# Altium schematic sheet Zotino-connector.SchDoc
size A3
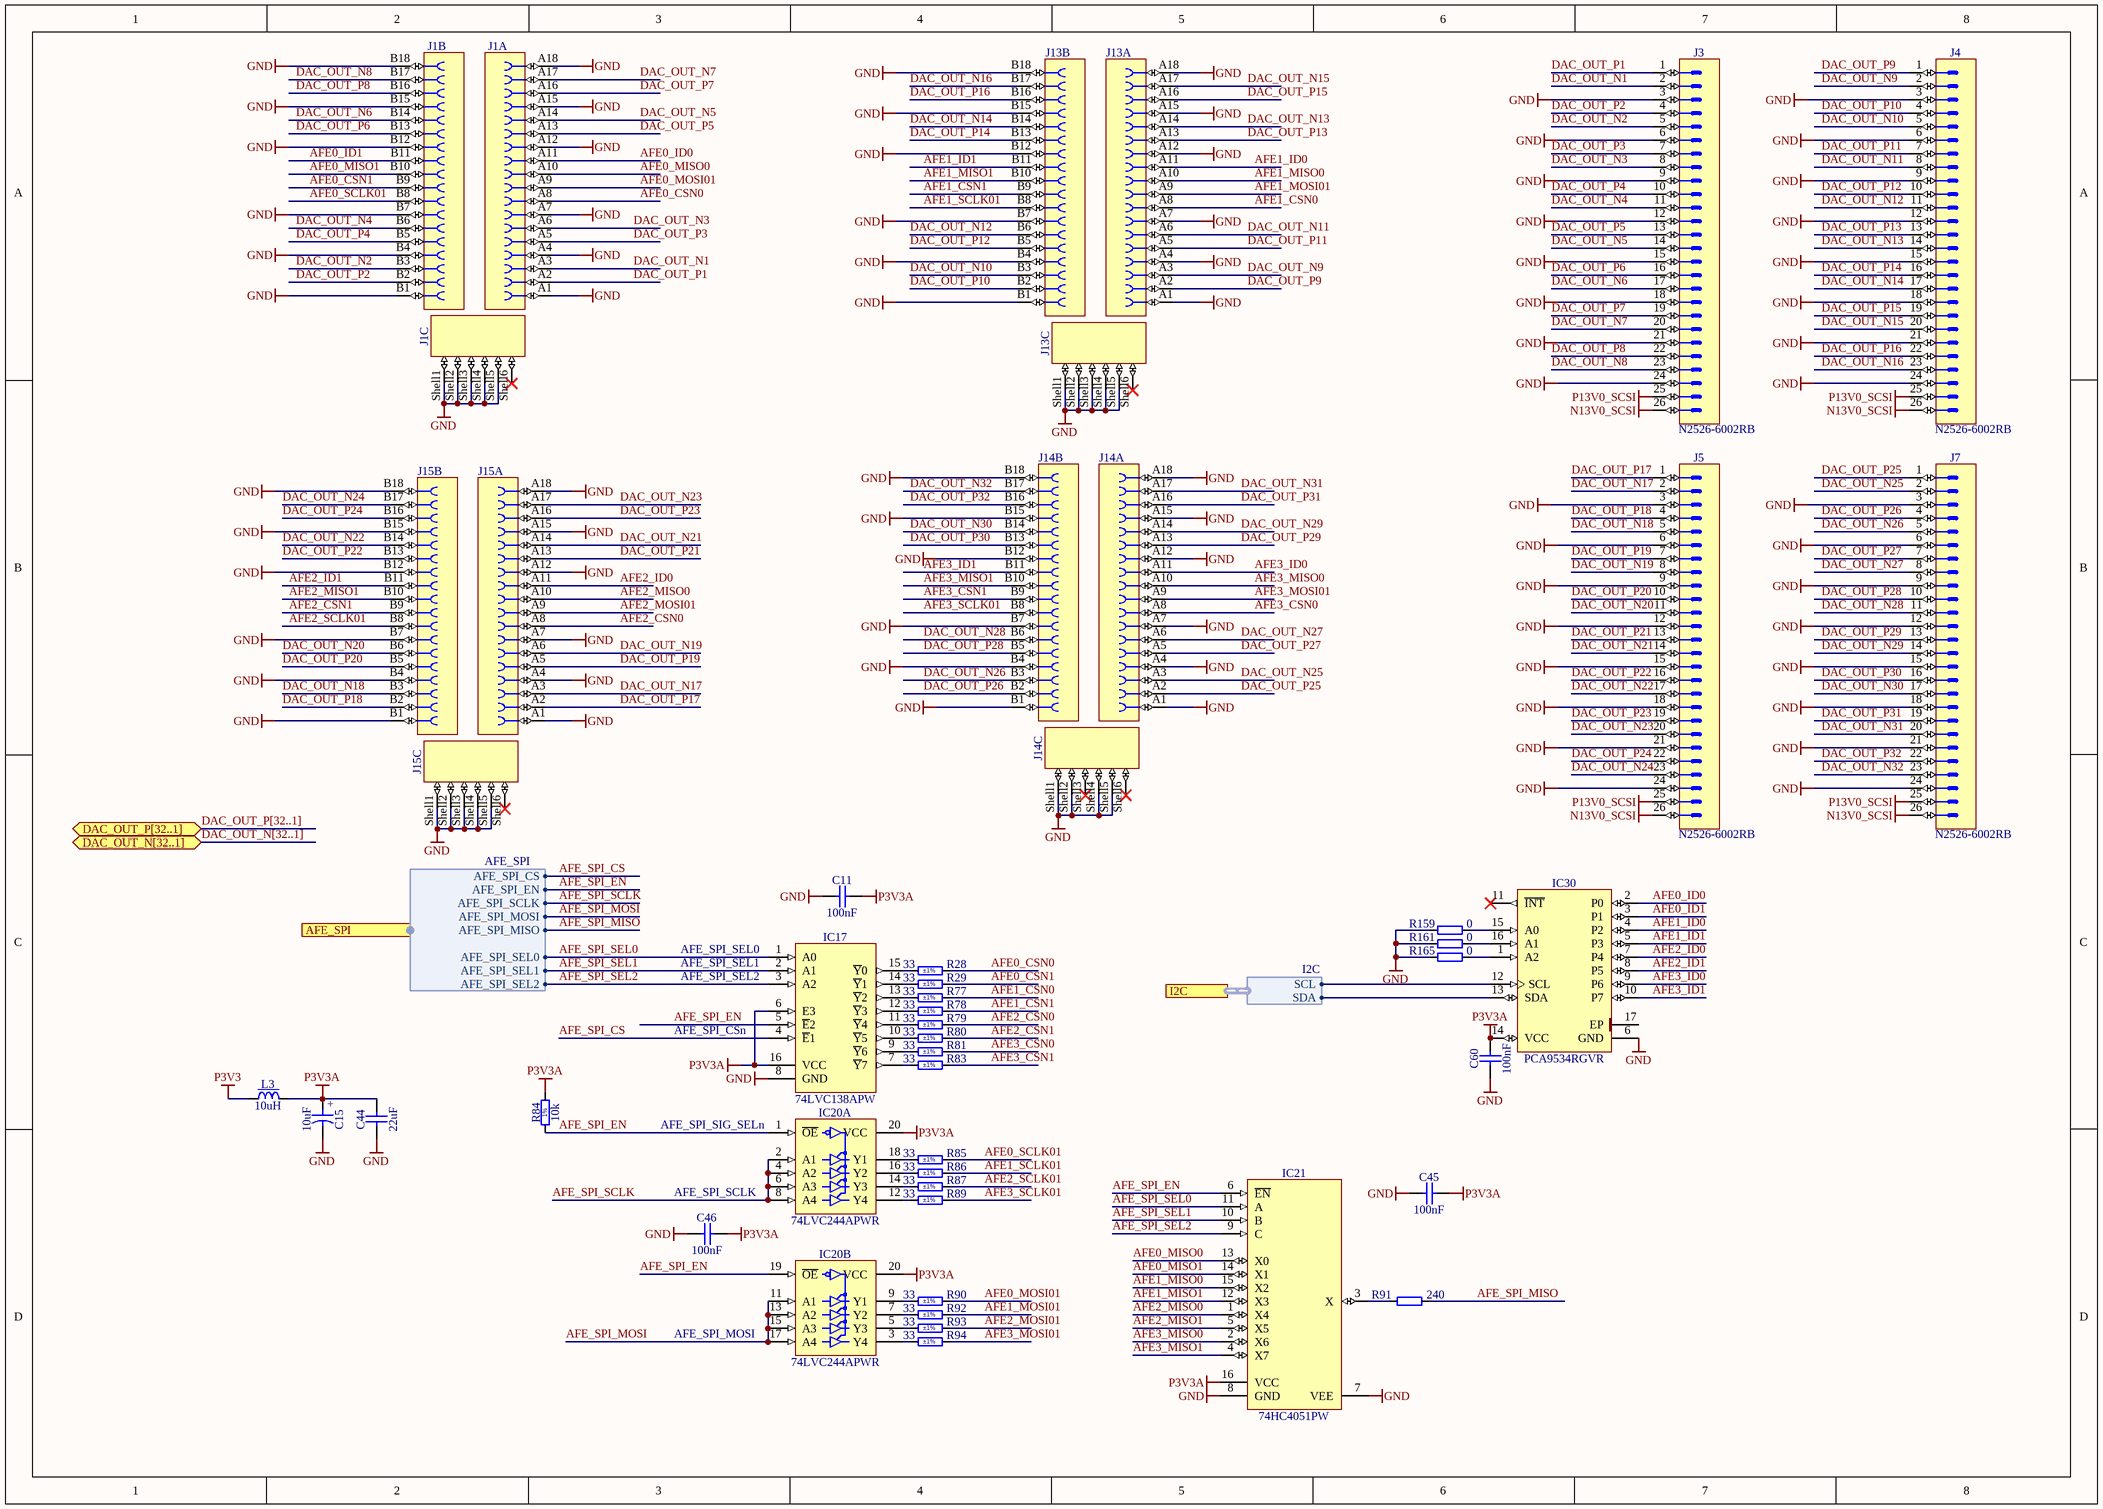
[diagram p0: Zotino-connector.SchDoc]

## Parts
C11  100nF  [CAPC1005X55N]
C15  10uF  [CAPMP3216X180N]
C44  22uF  [CAPC2012X135N]
C45  100nF  [CAPC1005X55N]
C46  100nF  [CAPC1005X55N]
C60  100nF  [CAPC1005X55N]
IC17  74LVC138APW  [SOP65P640X110-16N]
IC20  74LVC244APWR  [SOP65P640X110-20N]  (parts A,B of 2)
IC21  74HC4051PW  [SOP65P640X120-16N]
IC30  PCA9534RGVR  [QFN65P400X400X100-17N-S225]
J1  iPass™  [MOLEX_75783-0107]  (value not drawn)  (parts A,B,C of 3)
J3  Manufacturer Part Number: N2526-6002RB  [3M_N2526-6002RB]  (hidden comment: Header 26)
J4  Manufacturer Part Number: N2526-6002RB  [3M_N2526-6002RB]  (hidden comment: Header 26)
J5  Manufacturer Part Number: N2526-6002RB  [3M_N2526-6002RB]  (hidden comment: Header 26)
J7  Manufacturer Part Number: N2526-6002RB  [3M_N2526-6002RB]  (hidden comment: Header 26)
J13  iPass™  [MOLEX_75783-0107]  (value not drawn)  (parts A,B,C of 3)
J14  iPass™  [MOLEX_75783-0107]  (value not drawn)  (parts A,B,C of 3)
J15  iPass™  [MOLEX_75783-0107]  (value not drawn)  (parts A,B,C of 3)
L3  10uH  [IND_MURATA-PS_8400]
R28  33  Tolerance: ±1%  [RESC1005X40N]
R29  33  Tolerance: ±1%  [RESC1005X40N]
R77  33  Tolerance: ±1%  [RESC1005X40N]
R78  33  Tolerance: ±1%  [RESC1005X40N]
R79  33  Tolerance: ±1%  [RESC1005X40N]
R80  33  Tolerance: ±1%  [RESC1005X40N]
R81  33  Tolerance: ±1%  [RESC1005X40N]
R83  33  Tolerance: ±1%  [RESC1005X40N]
R84  10k  [RESC1005X40N]
R85  33  Tolerance: ±1%  [RESC1005X40N]
R86  33  Tolerance: ±1%  [RESC1005X40N]
R87  33  Tolerance: ±1%  [RESC1005X40N]
R89  33  Tolerance: ±1%  [RESC1005X40N]
R90  33  Tolerance: ±1%  [RESC1005X40N]
R91  240  [RESC1005X40N]
R92  33  Tolerance: ±1%  [RESC1005X40N]
R93  33  Tolerance: ±1%  [RESC1005X40N]
R94  33  Tolerance: ±1%  [RESC1005X40N]
R159  0  [RESC1005X40N]
R161  0  [RESC1005X40N]
R165  0  [RESC1005X40N]

## Ports
AFE_SPI (harness AFE_SPI), DAC_OUT_N[32..1] (bidir), DAC_OUT_P[32..1] (bidir), I2C (harness I2C)

## Harnesses
AFE_SPI: AFE_SPI_CS, AFE_SPI_EN, AFE_SPI_SCLK, AFE_SPI_MOSI, AFE_SPI_MISO, AFE_SPI_SEL0, AFE_SPI_SEL1, AFE_SPI_SEL2
I2C: SDA, SCL

## Nets
GND: C11.1 C15.2 C44.1 C45.1 C46.1 C60.1 IC17.8(GND) IC20.10(GND) IC21.7(VEE) IC21.8(GND) IC30.6(GND) J1.A1 J1.A4 J1.A7 J1.A12 J1.A15 J1.A18 J1.B1 J1.B4 J1.B7 J1.B12 J1.B15 J1.B18 J1.Shell1 J1.Shell2 J1.Shell3 J1.Shell4 J1.Shell5 J3.3 J3.6 J3.9 J3.12 J3.15 J3.18 J3.21 J3.24 J4.3 J4.6 J4.9 J4.12 J4.15 J4.18 J4.21 J4.24 J5.3 J5.6 J5.9 J5.12 J5.15 J5.18 J5.21 J5.24 J7.3 J7.6 J7.9 J7.12 J7.15 J7.18 J7.21 J7.24 J13.A1 J13.A4 J13.A7 J13.A12 J13.A15 J13.A18 J13.B1 J13.B4 J13.B7 J13.B12 J13.B15 J13.B18 J13.Shell1 J13.Shell2 J13.Shell3 J13.Shell4 J13.Shell5 J14.A1 J14.A4 J14.A7 J14.A12 J14.A15 J14.A18 J14.B1 J14.B4 J14.B7 J14.B12 J14.B15 J14.B18 J14.Shell1 J14.Shell2 J14.Shell4 J14.Shell5 J15.A1 J15.A4 J15.A7 J15.A12 J15.A15 J15.A18 J15.B1 J15.B4 J15.B7 J15.B12 J15.B15 J15.B18 J15.Shell1 J15.Shell2 J15.Shell3 J15.Shell4 J15.Shell5 R159.1 R161.1 R165.1
N13V0_SCSI: J3.26 J4.26 J5.26 J7.26
P3V3: L3.1
P3V3A: C11.2 C15.1 C44.2 C45.2 C46.2 C60.2 IC17.6(E3) IC17.16(VCC) IC20.20(VCC) IC21.16(VCC) IC30.14(VCC) L3.2 R84.2
P13V0_SCSI: J3.25 J4.25 J5.25 J7.25
AFE0_CSN0: J1.A8 R28.2
AFE0_CSN1: J1.B9 R29.2
AFE0_ID0: IC30.2(P0) J1.A11
AFE0_ID1: IC30.3(P1) J1.B11
AFE0_MISO0: IC21.13(X0) J1.A10
AFE0_MISO1: IC21.14(X1) J1.B10
AFE0_MOSI01: J1.A9 R90.2
AFE0_SCLK01: J1.B8 R85.2
AFE1_CSN0: J13.A8 R77.2
AFE1_CSN1: J13.B9 R78.2
AFE1_ID0: IC30.4(P2) J13.A11
AFE1_ID1: IC30.5(P3) J13.B11
AFE1_MISO0: IC21.15(X2) J13.A10
AFE1_MISO1: IC21.12(X3) J13.B10
AFE1_MOSI01: J13.A9 R92.2
AFE1_SCLK01: J13.B8 R86.2
AFE2_CSN0: J15.A8 R79.2
AFE2_CSN1: J15.B9 R80.2
AFE2_ID0: IC30.7(P4) J15.A11
AFE2_ID1: IC30.8(P5) J15.B11
AFE2_MISO0: IC21.1(X4) J15.A10
AFE2_MISO1: IC21.5(X5) J15.B10
AFE2_MOSI01: J15.A9 R93.2
AFE2_SCLK01: J15.B8 R87.2
AFE3_CSN0: J14.A8 R81.2
AFE3_CSN1: J14.B9 R83.2
AFE3_ID0: IC30.9(P6) J14.A11
AFE3_ID1: IC30.10(P7) J14.B11
AFE3_MISO0: IC21.2(X6) J14.A10
AFE3_MISO1: IC21.4(X7) J14.B10
AFE3_MOSI01: J14.A9 R94.2
AFE3_SCLK01: J14.B8 R89.2
AFE_SPI_CS: IC17.4(~{E}1) ; port AFE_SPI.AFE_SPI_CS
AFE_SPI_EN: IC17.5(~{E}2) IC20.1(~{OE}) IC20.19(~{OE}) IC21.6(~{EN}) R84.1 ; port AFE_SPI.AFE_SPI_EN
AFE_SPI_MISO: R91.2 ; port AFE_SPI.AFE_SPI_MISO
AFE_SPI_MOSI: IC20.11(A1) IC20.13(A2) IC20.15(A3) IC20.17(A4) ; port AFE_SPI.AFE_SPI_MOSI
AFE_SPI_SCLK: IC20.2(A1) IC20.4(A2) IC20.6(A3) IC20.8(A4) ; port AFE_SPI.AFE_SPI_SCLK
AFE_SPI_SEL0: IC17.1(A0) IC21.11(A) ; port AFE_SPI.AFE_SPI_SEL0
AFE_SPI_SEL1: IC17.2(A1) IC21.10(B) ; port AFE_SPI.AFE_SPI_SEL1
AFE_SPI_SEL2: IC17.3(A2) IC21.9(C) ; port AFE_SPI.AFE_SPI_SEL2
DAC_OUT_N1: J1.A3 J3.2
DAC_OUT_N2: J1.B3 J3.5
DAC_OUT_N3: J1.A6 J3.8
DAC_OUT_N4: J1.B6 J3.11
DAC_OUT_N5: J1.A14 J3.14
DAC_OUT_N6: J1.B14 J3.17
DAC_OUT_N7: J1.A17 J3.20
DAC_OUT_N8: J1.B17 J3.23
DAC_OUT_N9: J4.2 J13.A3
DAC_OUT_N10: J4.5 J13.B3
DAC_OUT_N11: J4.8 J13.A6
DAC_OUT_N12: J4.11 J13.B6
DAC_OUT_N13: J4.14 J13.A14
DAC_OUT_N14: J4.17 J13.B14
DAC_OUT_N15: J4.20 J13.A17
DAC_OUT_N16: J4.23 J13.B17
DAC_OUT_N17: J5.2 J15.A3
DAC_OUT_N18: J5.5 J15.B3
DAC_OUT_N19: J5.8 J15.A6
DAC_OUT_N20: J5.11 J15.B6
DAC_OUT_N21: J5.14 J15.A14
DAC_OUT_N22: J5.17 J15.B14
DAC_OUT_N23: J5.20 J15.A17
DAC_OUT_N24: J5.23 J15.B17
DAC_OUT_N25: J7.2 J14.A3
DAC_OUT_N26: J7.5 J14.B3
DAC_OUT_N27: J7.8 J14.A6
DAC_OUT_N28: J7.11 J14.B6
DAC_OUT_N29: J7.14 J14.A14
DAC_OUT_N30: J7.17 J14.B14
DAC_OUT_N31: J7.20 J14.A17
DAC_OUT_N32: J7.23 J14.B17
DAC_OUT_P1: J1.A2 J3.1
DAC_OUT_P2: J1.B2 J3.4
DAC_OUT_P3: J1.A5 J3.7
DAC_OUT_P4: J1.B5 J3.10
DAC_OUT_P5: J1.A13 J3.13
DAC_OUT_P6: J1.B13 J3.16
DAC_OUT_P7: J1.A16 J3.19
DAC_OUT_P8: J1.B16 J3.22
DAC_OUT_P9: J4.1 J13.A2
DAC_OUT_P10: J4.4 J13.B2
DAC_OUT_P11: J4.7 J13.A5
DAC_OUT_P12: J4.10 J13.B5
DAC_OUT_P13: J4.13 J13.A13
DAC_OUT_P14: J4.16 J13.B13
DAC_OUT_P15: J4.19 J13.A16
DAC_OUT_P16: J4.22 J13.B16
DAC_OUT_P17: J5.1 J15.A2
DAC_OUT_P18: J5.4 J15.B2
DAC_OUT_P19: J5.7 J15.A5
DAC_OUT_P20: J5.10 J15.B5
DAC_OUT_P21: J5.13 J15.A13
DAC_OUT_P22: J5.16 J15.B13
DAC_OUT_P23: J5.19 J15.A16
DAC_OUT_P24: J5.22 J15.B16
DAC_OUT_P25: J7.1 J14.A2
DAC_OUT_P26: J7.4 J14.B2
DAC_OUT_P27: J7.7 J14.A5
DAC_OUT_P28: J7.10 J14.B5
DAC_OUT_P29: J7.13 J14.A13
DAC_OUT_P30: J7.16 J14.B13
DAC_OUT_P31: J7.19 J14.A16
DAC_OUT_P32: J7.22 J14.B16
NetIC17_7: IC17.7(~{Y}7) R83.1
NetIC17_9: IC17.9(~{Y}6) R81.1
NetIC17_10: IC17.10(~{Y}5) R80.1
NetIC17_11: IC17.11(~{Y}4) R79.1
NetIC17_12: IC17.12(~{Y}3) R78.1
NetIC17_13: IC17.13(~{Y}2) R77.1
NetIC17_14: IC17.14(~{Y}1) R29.1
NetIC17_15: IC17.15(~{Y}0) R28.1
NetIC20_3: IC20.3(Y4) R94.1
NetIC20_5: IC20.5(Y3) R93.1
NetIC20_7: IC20.7(Y2) R92.1
NetIC20_9: IC20.9(Y1) R90.1
NetIC20_12: IC20.12(Y4) R89.1
NetIC20_14: IC20.14(Y3) R87.1
NetIC20_16: IC20.16(Y2) R86.1
NetIC20_18: IC20.18(Y1) R85.1
NetIC21_3: IC21.3(X) R91.1
NetIC30_1: IC30.1(A2) R165.2
NetIC30_12: IC30.12(SCL) ; port I2C.SCL
NetIC30_13: IC30.13(SDA) ; port I2C.SDA
NetIC30_15: IC30.15(A0) R159.2
NetIC30_16: IC30.16(A1) R161.2

Not connected (* = marked no-connect by the designer): IC30 11(~{INT})* 17(EP); J1 Shell6*; J13 Shell6*; J14 Shell3* Shell6*; J15 Shell6*

## Buses and harness runs
bus DAC_OUT_N[32..1] = port DAC_OUT_N[32..1]
bus DAC_OUT_P[32..1] = port DAC_OUT_P[32..1]

## Notes on the sheet
- (near IC17) AFE_SPI_SEL0
- (near IC17) AFE_SPI_SEL1
- (near IC17) AFE_SPI_SEL2
- AFE_SPI_CSn
- AFE_SPI_SIG_SELn
- AFE_SPI_SCLK
- (near IC20) AFE_SPI_MOSI
- (in symbol CTE3216-18_10UF_16V_20%_AVX_TCJ) +
- (in symbol R0402_10K_1%_0.0625W_100PPM) 1%

## Library data of the parts
C11 C45 C46 C60 = CC0402_100NF_16V_10%_X5R: Non-polarised capacitor; Part Description: SMD Multilayer Chip Ceramic Capacitor; Manufacturer: GENERIC; Manufacturer1 Part Number: GRM155R61C104KA88D; Voltage: 16V; TC: X5R; Tolerance: ±10%; Part Number: CC0402_100NF_16V_10%_X5R; Component Kind: Standard; Component Type: Standard; Pin Count: 2; Value: 100nF; Status: None; Manufacturer Part Number: CC0402_100NF_16V_10%_X5R; Case: 0402; Mounted: Yes; Socket: No; SMD: Yes; Sense: No; Manufacturer1 Example: MURATA; Manufacturer1 ComponentHeight: 0.55mm; HelpURL: \\cern.ch\dfs\Applications\Altium\Datasheets\CC0402_X5R_MURATA_GRM.pdf; Author: CERN DEM JLC; CreateDate: 10.12.2013; LatestRevisionDate: 10.12.2013
C15 = CTE3216-18_10UF_16V_20%_AVX_TCJ: Polarised capacitor; Part Description: ESR 0R200 Tantalum Solid Electrolytic Chip Capacitor with Conductive Polymer Electrode; Manufacturer: AVX; Manufacturer Part Number: TCJA106M016R0200 or  or TR3A106K016C1700; Voltage: 16V; Tolerance: ±20%; Part Number: CTE3216-18_10UF_16V_20%_AVX_TCJ; Component Kind: Standard; Component Type: Standard; Pin Count: 2; Value: 10uF; Status: Preferred; Case: A; Mounted: Yes; Socket: No; SMD: Yes; Sense: No; ComponentHeight: 1.8mm; HelpURL: \\cern.ch\dfs\Applications\Altium\Datasheets\CTE_AVX_TCJ.pdf; Author: CERN DEM JLC; CreateDate: 29.03.2012; LatestRevisionDate: 29.03.2012
C44 = CC0805_22UF_16V_10%_X5R: Non-polarised capacitor; Part Description: SMD Multilayer Chip Ceramic Capacitor; Manufacturer: GENERIC; Manufacturer1 Part Number: C2012X5R1C226KT; Voltage: 16V; TC: X5R; Tolerance: ±10%; Part Number: CC0805_22UF_16V_10%_X5R; Component Kind: Standard; Component Type: Standard; Pin Count: 2; Value: 22uF; Status: Preferred; Manufacturer Part Number: CC0805_22UF_16V_10%_X5R; Case: 0805; Mounted: Yes; Socket: No; SMD: Yes; Sense: No; Manufacturer1 Example: TDK; Manufacturer1 ComponentHeight: 1.35mm; HelpURL: \\cern.ch\dfs\Applications\Altium\Datasheets\CC0805_X5R_TDK_C.pdf; Author: CERN DEM JLC; CreateDate: 25.10.2012; LatestRevisionDate: 25.10.2012
IC17 = 74LVC138APW: 3-Line to 8-Line Decoder/Demultiplexer; Part Description: 3-Line to 8-Line Decoder/Demultiplexer, Inverting; Manufacturer: NEXPERIA; PressFit: No; Bonding: No; Part Number: 74LVC138APW; Component Kind: Standard; Component Type: Standard; Device: 74LVC138APW; PackageDescription: SOP, 0.65mm Pitch; 16 Pin, 4.40mm W X 5.00mm L X 1.10mm H body IPC Medium Density; Manufacturer Part Number: 74LVC138APW; Pin Count: 16; Case: TSSOP16; Mounted: Yes; Socket: No; SMD: Yes; Sense: No; ComponentHeight: 1.1mm; Author: CERN DEM HF; HelpURL: \\cern.ch\dfs\Applications\Altium\Datasheets\74LVC138A.pdf; CreateDate: 14.10.2022; LatestRevisionDate: 14.10.2022
IC20 = 74LVC244APW: Octal Buffer/Driver with 3-State Ouputs; Part Description: Octal Buffer/Driver with 3-State Outputs; Manufacturer: TEXAS INSTRUMENTS; PressFit: No; Bonding: No; Part Number: 74LVC244APWR; Component Kind: Standard; Component Type: Standard; Device: 74LVC244APWR; PackageDescription: SOP, 20-Leads, Body 6.6x4.5mm (max), Pitch 0.65mm, IPC Medium Density; Manufacturer Part Number: 74LVC244APW; Pin Count: 20; Case: TSSOP20; Mounted: Yes; Socket: No; SMD: Yes; Sense: No; ComponentHeight: 1.1mm; Author: GK; HelpURL: \\cern.ch\dfs\Applications\Altium\Datasheets\SN74LVC244A.pdf; CreateDate: 20.12.2010; LatestRevisionDate: 22.03.2021
IC21 = 74HC4051PW: 8-Channel Analog Multiplexer/Demultiplexer; Manufacturer: NXP; PressFit: No; Bonding: No; Part Number: 74HC4051PW; Component Kind: Standard; Component Type: Standard; Device: 74HC4051PW; PackageDescription: SOP, 0.65mm Pitch; 16 Pin, 4.40mm W X 5.00mm L X 1.20mm H body, IPC Medium Density; Part Description: 8-Channel Analog Multiplexer/Demultiplexer; Manufacturer Part Number: 74HC4051PW; Pin Count: 16; Case: TSSOP16; Mounted: Yes; Socket: No; SMD: Yes; Sense: No; ComponentHeight: 1.2mm; Author: GK; HelpURL: \\cern.ch\dfs\Applications\Altium\Datasheets\TC74HC4051AFT.pdf; CreateDate: 09.11.2011; LatestRevisionDate: 09.11.2011
IC30 = PCA9534RGVR: Remote 8-Bit I2C and SMBus Low-Power I/O Expander With Interrupt Output and Configuration Registers; Manufacturer: TEXAS INSTRUMENTS; PressFit: No; Bonding: No; Part Number: PCA9534RGVR; Component Kind: Standard; Component Type: Standard; Device: PCA9534RGVR; PackageDescription: QFN, 0.65mm Pitch, Square; 16 Pin, 4.00mm L X 4.00mm W X 1.00mm H body (w/Thermal Tab 2.25 X 2.25mm), IPC Medium Density; Part Description: Remote 8-Bit I2C and SMBus Low-Power I/O Expander with Interrupt Output and Configuration Registers; Manufacturer Part Number: PCA9534RGV; Pin Count: 17; Case: QFN16; Mounted: Yes; Socket: No; SMD: Yes; Sense: No; ComponentHeight: 1mm; Author: CERN DEM JLC; HelpURL: \\cern.ch\dfs\Applications\Altium\Datasheets\PCA9534RGVR.pdf; CreateDate: 23.05.2018; LatestRevisionDate: 13.06.2022
J1 J13-J15 = MOLEX_75783-0107: 36 Circuit, Right Angle , Internal Assembly, iPass™ I/O Surface Mount Receptacle with Left Key Shell; Part Number: MOLEX 75783-0107 / 75783-0136; Manufacturer: MOLEX; Manufacturer Part Number: 75783-0107 / 75783-0136; PressFit: No; Component Kind: Standard; Component Type: Standard; Pin Count: 42; Family: iPass™; Mounted: Yes; Socket: No; SMD: Yes; Sense: No; Status: None; Part Description: 36 Circuit, Right Angle , Internal Assembly, iPass™ I/O Surface Mount Receptacle with Left Key Shell; ComponentHeight: 8.47mm; HelpURL: \\cern.ch\dfs\Applications\Altium\Datasheets\MOLEX_75783-0107.pdf; Author: CERN DEM JLC; CreateDate: 12.11.2014; LatestRevisionDate: 12.11.2014
J3-J5 J7 = 3M_N2526-6002RB: Connector 26 Male; Part Description: 26 Contacts - Straight .100'' x .100'' Low Profile Four-Wall Header, 2500 Series; Manufacturer: 3M; PressFit: No; Part Number: 3M_N2526-6002RB; Component Kind: Standard; Component Type: Standard; Pin Count: 26; Family: Header 26; Mounted: Yes; Socket: No; SMD: No; Sense: No; Status: None; ComponentHeight: 10.03mm; HelpURL: \\cern.ch\dfs\Applications\Altium\Datasheets\3M_N2526-6002RB.pdf; Author: CERN DEM JLC; CreateDate: 11.02.2009; LatestRevisionDate: 11.08.2009
L3 = IND_10UH_10%_MURATA-PS_8400: Inductor With Core; Part Description: Miniature Surface Mount Power Inductor (8400 Serie); Manufacturer: MURATA POWER SOLUTIONS; Manufacturer Part Number: 84103C; Power: 950mA; Resistance: 0.24R; Tolerance: ±10%; Part Number: IND_10UH_10%_MURATA-PS_8400; Component Kind: Standard; Component Type: Standard; Pin Count: 2; Value: 10uH; Status: None; Mounted: Yes; Socket: No; SMD: Yes; Sense: No; ComponentHeight: 2.9mm; HelpURL: \\cern.ch\dfs\Applications\Altium\Datasheets\IND_MURATA-PS_8400.pdf; Author: CERN DEM JLC; CreateDate: 02.07.2012; LatestRevisionDate: 02.07.2012
R28 R29 R77-R81 R83 R85-R87 R89 R90 R92-R94 = R0402_33R_1%_0.0625W_100PPM: Resistor - 1%; Part Description: General Purpose Thick Film Chip Resistor; Manufacturer: GENERIC; Manufacturer1 Part Number: 232270673309L; TC: ±100ppm/°C; PressFit: No; Part Number: R0402_33R_1%_0.0625W_100PPM; Component Kind: Standard; Component Type: Standard; Pin Count: 2; Value: 33; Status: Not Recommended; Power: 0.0625W; Manufacturer Part Number: R0402_33R_1%_0.0625W_100PPM; Case: 0402; Mounted: Yes; Sense: No; Socket: No; SMD: Yes; Manufacturer1 Example: YAGEO PHYCOMP; Manufacturer1 ComponentHeight: 0.4mm; HelpURL: \\cern.ch\dfs\Applications\Altium\Datasheets\R0402_Phycomp_RC0402.pdf; Author: CERN DEM JLC; CreateDate: 03.12.2007; LatestRevisionDate: 17.10.2012
R84 = R0402_10K_1%_0.0625W_100PPM: Resistor - 1%; Part Description: General Purpose Thick Film Chip Resistor; Manufacturer: GENERIC; Manufacturer1 Part Number: 232270671003L; TC: ±100ppm/°C; PressFit: No; Part Number: R0402_10K_1%_0.0625W_100PPM; Component Kind: Standard; Component Type: Standard; Pin Count: 2; Value: 10k; Status: Not Recommended; Power: 0.0625W; Tolerance: ±1%; Manufacturer Part Number: R0402_10K_1%_0.0625W_100PPM; Case: 0402; Mounted: Yes; Sense: No; Socket: No; SMD: Yes; Manufacturer1 Example: YAGEO PHYCOMP; Manufacturer1 ComponentHeight: 0.4mm; HelpURL: \\cern.ch\dfs\Applications\Altium\Datasheets\R0402_Phycomp_RC0402.pdf; Author: CERN DEM JLC; CreateDate: 03.12.2007; LatestRevisionDate: 17.10.2012
R91 = R0402_240R_1%_0.0625W_100PPM: Resistor - 1%; Part Description: General Purpose Thick Film Chip Resistor; Manufacturer: GENERIC; Manufacturer1 Part Number: 232270672401L; TC: ±100ppm/°C; PressFit: No; Part Number: R0402_240R_1%_0.0625W_100PPM; Component Kind: Standard; Component Type: Standard; Pin Count: 2; Value: 240; Status: Not Recommended; Power: 0.0625W; Tolerance: ±1%; Manufacturer Part Number: R0402_240R_1%_0.0625W_100PPM; Case: 0402; Mounted: Yes; Sense: No; Socket: No; SMD: Yes; Manufacturer1 Example: YAGEO PHYCOMP; Manufacturer1 ComponentHeight: 0.4mm; HelpURL: \\cern.ch\dfs\Applications\Altium\Datasheets\R0402_Phycomp_RC0402.pdf; Author: CERN DEM JLC; CreateDate: 03.12.2007; LatestRevisionDate: 17.10.2012
R159 R161 R165 = R0402_0R_JUMPER: Resistor; Part Description: 1A (0.05R Max DC Resistance) Zero Ohm Jumper; Manufacturer: GENERIC; Manufacturer1 Part Number: 232270591001L; PressFit: No; Part Number: R0402_0R_JUMPER; Component Kind: Standard; Component Type: Standard; Pin Count: 2; Value: 0; Status: Not Recommended; Manufacturer Part Number: R0402_0R_JUMPER; Case: 0402; Mounted: Yes; Sense: No; Socket: No; SMD: Yes; Manufacturer1 Example: YAGEO PHYCOMP; Manufacturer1 ComponentHeight: 0.4mm; HelpURL: \\cern.ch\dfs\Applications\Altium\Datasheets\R0402_Phycomp_RC0402.pdf; Author: CERN DEM JLC; CreateDate: 03.12.2007; LatestRevisionDate: 17.10.2012